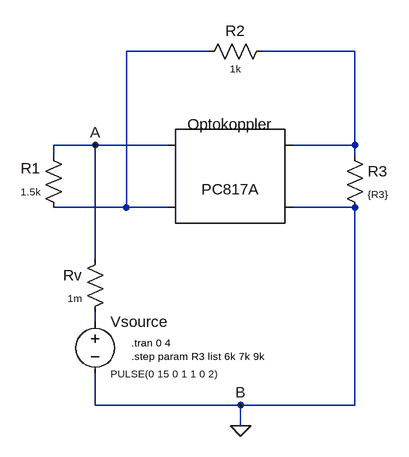
[diagram p0: schematic 03_Optokoppler_var_R3.asc]
03_Optokoppler_var_R3.asc, the LTspice schematic file:
Version 4
SHEET 1 1144 680
WIRE 448 80 320 80
WIRE 672 80 528 80
WIRE 272 224 208 224
WIRE 384 224 272 224
WIRE 672 224 672 80
WIRE 672 224 576 224
WIRE 208 240 208 224
WIRE 672 240 672 224
WIRE 320 320 320 80
WIRE 320 320 208 320
WIRE 384 320 320 320
WIRE 672 320 576 320
WIRE 272 400 272 224
WIRE 272 496 272 480
WIRE 272 624 272 576
WIRE 496 624 272 624
WIRE 672 624 672 320
WIRE 672 624 496 624
WIRE 496 656 496 624
FLAG 496 656 0
FLAG 496 624 B
FLAG 272 224 A
SYMBOL res 224 336 R180
WINDOW 0 36 76 Left 2
WINDOW 3 36 40 Left 1
SYMATTR InstName R1
SYMATTR Value 1.5k
SYMBOL res 288 384 M0
WINDOW 0 36 40 Left 2
WINDOW 3 36 76 Left 1
SYMATTR InstName Rv
SYMATTR Value 1m
SYMBOL res 656 224 R0
WINDOW 0 36 40 Left 2
WINDOW 3 36 76 Left 1
SYMATTR InstName R3
SYMATTR Value {R3}
SYMBOL res 432 96 R270
WINDOW 0 32 56 VTop 2
WINDOW 3 0 56 VBottom 1
SYMATTR InstName R2
SYMATTR Value 1k
SYMBOL Optos/PC817A 480 272 R0
WINDOW 0 0 -80 Center 2
SYMATTR InstName Optokoppler
SYMBOL voltage 272 480 R0
WINDOW 3 24 96 Left 1
SYMATTR Value PULSE(0 15 0 1 1 0 2)
SYMATTR InstName Vsource
TEXT 328 528 Left 1 !.tran 0 4\n.step param R3 list 6k 7k 9k

The netlist it stands for:
* 03_Optokoppler_var_R3.asc
R1 N001 A 1.5k
Rv A N003 1m
R3 N002 0 {R3}
R2 N001 N002 1k
XOptokoppler A N001 N002 0 PC817 Igain=1m
Vsource N003 0 PULSE(0 15 0 1 1 0 2)
.tran 0 4
.step param R3 list 6k 7k 9k
.lib PC817.sub
.backanno
.end